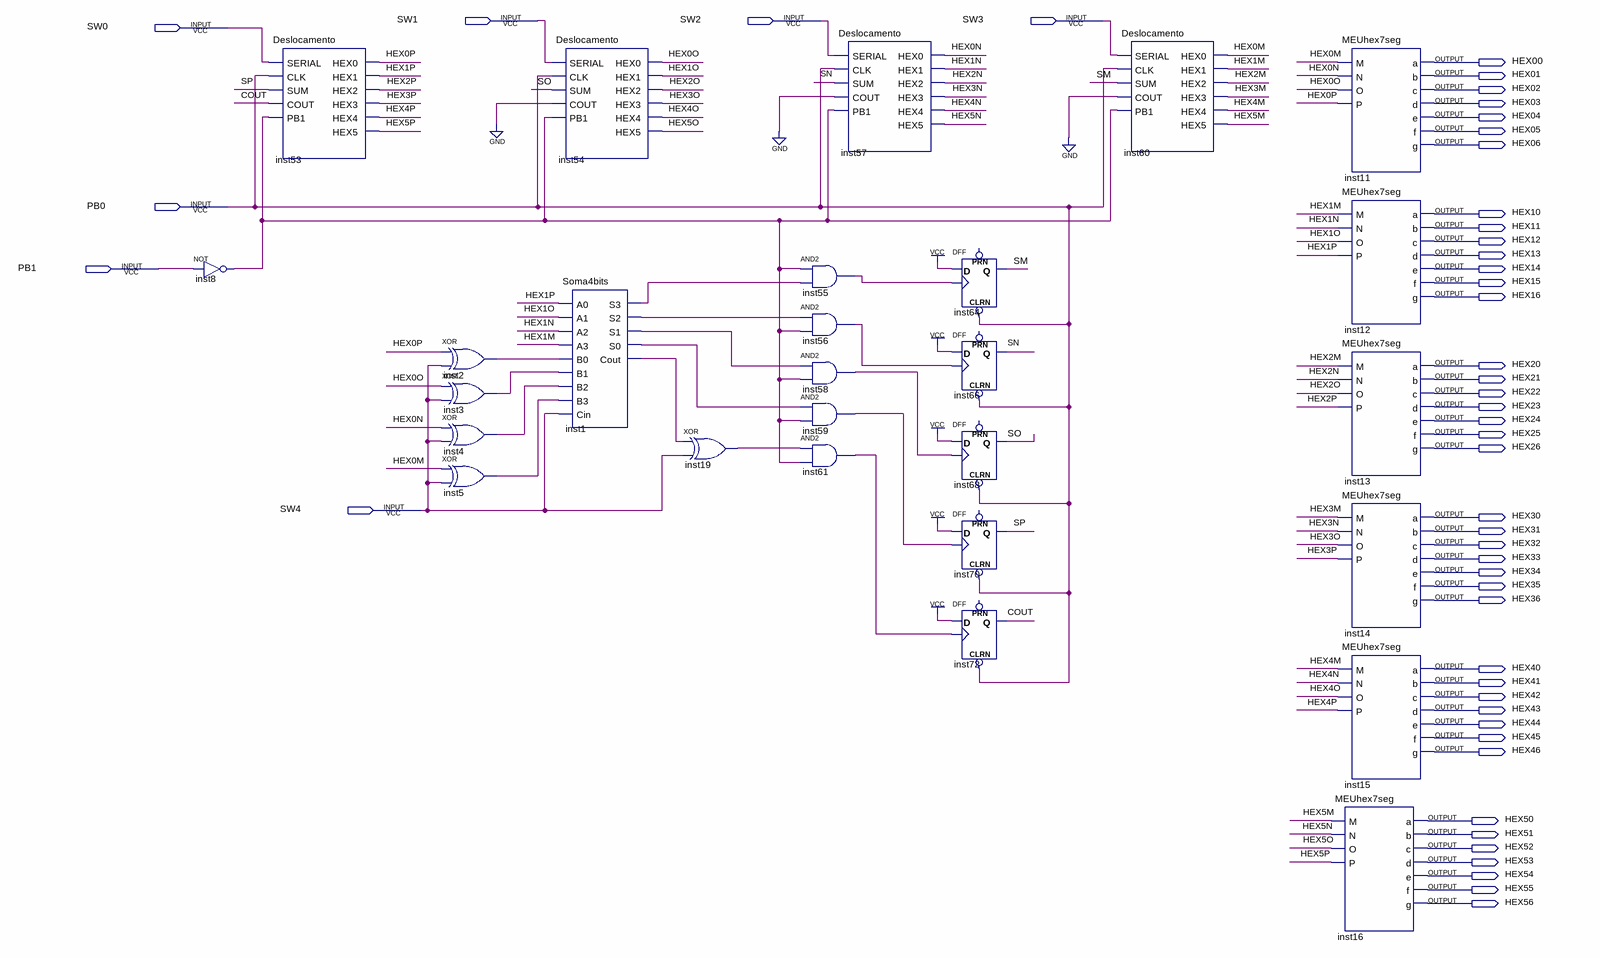
[diagram p0: schematic sheet]
// Quartus schematic Lab2-2.bdf as structural Verilog: 27 symbols, 49 pins
module \Lab2-2  (
  input  SW1,
  input  SW2,
  input  SW3,
  input  SW0,
  input  PB0,
  input  PB1,
  input  SW4,
  output HEX00,
  output HEX01,
  output HEX02,
  output HEX03,
  output HEX04,
  output HEX05,
  output HEX06,
  output HEX10,
  output HEX11,
  output HEX12,
  output HEX13,
  output HEX14,
  output HEX15,
  output HEX16,
  output HEX20,
  output HEX21,
  output HEX22,
  output HEX23,
  output HEX24,
  output HEX25,
  output HEX26,
  output HEX30,
  output HEX31,
  output HEX32,
  output HEX33,
  output HEX34,
  output HEX35,
  output HEX36,
  output HEX40,
  output HEX41,
  output HEX42,
  output HEX43,
  output HEX44,
  output HEX45,
  output HEX46,
  output HEX50,
  output HEX51,
  output HEX52,
  output HEX53,
  output HEX54,
  output HEX55,
  output HEX56
);

  wire COUT, HEX0M, HEX0N, HEX0O, HEX0P, HEX1M, HEX1N, HEX1O, HEX1P, HEX2M, HEX2N, HEX2O, HEX2P, HEX3M,
       HEX3N, HEX3O, HEX3P, HEX4M, HEX4N, HEX4O, HEX4P, HEX5M, HEX5N, HEX5O, HEX5P, inst1_cout, inst1_s0,
       inst1_s1, inst1_s2, inst1_s3, inst2_out, inst3_out, inst4_out, inst5_out, inst8_out, inst19_out,
       inst55_out, inst56_out, inst58_out, inst59_out, inst61_out, SM, SN, SO, SP;

  not inst8 (inst8_out, PB1);
  Deslocamento inst53 (
    .SERIAL(SW0), .CLK(PB0), .SUM(SP), .COUT(COUT), .PB1(inst8_out), .HEX0(HEX0P), .HEX1(HEX1P),
    .HEX2(HEX2P), .HEX3(HEX3P), .HEX4(HEX4P), .HEX5(HEX5P));
  xor inst2 (inst2_out, HEX0P, SW4);
  xor inst3 (inst3_out, HEX0O, SW4);
  xor inst4 (inst4_out, HEX0N, SW4);
  xor inst5 (inst5_out, HEX0M, SW4);
  Deslocamento inst54 (
    .SERIAL(SW1), .CLK(PB0), .SUM(SO), .COUT(1'b0), .PB1(inst8_out), .HEX0(HEX0O), .HEX1(HEX1O),
    .HEX2(HEX2O), .HEX3(HEX3O), .HEX4(HEX4O), .HEX5(HEX5O));
  Soma4bits inst1 (
    .A0(HEX1P), .A1(HEX1O), .A2(HEX1N), .A3(HEX1M), .B0(inst2_out), .B1(inst3_out), .B2(inst4_out),
    .B3(inst5_out), .Cin(SW4), .S3(inst1_s3), .S2(inst1_s2), .S1(inst1_s1), .S0(inst1_s0), .Cout(inst1_cout));
  xor inst19 (inst19_out, inst1_cout, SW4);
  and inst55 (inst55_out, inst8_out, inst1_s3);
  and inst56 (inst56_out, inst1_s2, inst8_out);
  and inst58 (inst58_out, inst1_s1, inst8_out);
  and inst59 (inst59_out, inst1_s0, inst8_out);
  and inst61 (inst61_out, inst19_out, inst8_out);
  Deslocamento inst57 (
    .SERIAL(SW2), .CLK(PB0), .SUM(SN), .COUT(1'b0), .PB1(inst8_out), .HEX0(HEX0N), .HEX1(HEX1N),
    .HEX2(HEX2N), .HEX3(HEX3N), .HEX4(HEX4N), .HEX5(HEX5N));
  DFF inst64 (.CLRN(PB0), .CLK(inst55_out), .D(1'b1), .Q(SM));  // open: PRN
  DFF inst66 (.CLRN(PB0), .CLK(inst56_out), .D(1'b1), .Q(SN));  // open: PRN
  DFF inst68 (.CLRN(PB0), .CLK(inst58_out), .D(1'b1), .Q(SO));  // open: PRN
  DFF inst70 (.CLRN(PB0), .CLK(inst59_out), .D(1'b1), .Q(SP));  // open: PRN
  DFF inst72 (.CLRN(PB0), .CLK(inst61_out), .D(1'b1), .Q(COUT));  // open: PRN
  Deslocamento inst60 (
    .SERIAL(SW3), .CLK(PB0), .SUM(SM), .COUT(1'b0), .PB1(inst8_out), .HEX0(HEX0M), .HEX1(HEX1M),
    .HEX2(HEX2M), .HEX3(HEX3M), .HEX4(HEX4M), .HEX5(HEX5M));
  MEUhex7seg inst11 (
    .M(HEX0M), .N(HEX0N), .O(HEX0O), .P(HEX0P), .a(HEX00), .b(HEX01), .c(HEX02), .d(HEX03), .e(HEX04),
    .f(HEX05), .g(HEX06));
  MEUhex7seg inst12 (
    .M(HEX1M), .N(HEX1N), .O(HEX1O), .P(HEX1P), .a(HEX10), .b(HEX11), .c(HEX12), .d(HEX13), .e(HEX14),
    .f(HEX15), .g(HEX16));
  MEUhex7seg inst13 (
    .M(HEX2M), .N(HEX2N), .O(HEX2O), .P(HEX2P), .a(HEX20), .b(HEX21), .c(HEX22), .d(HEX23), .e(HEX24),
    .f(HEX25), .g(HEX26));
  MEUhex7seg inst14 (
    .M(HEX3M), .N(HEX3N), .O(HEX3O), .P(HEX3P), .a(HEX30), .b(HEX31), .c(HEX32), .d(HEX33), .e(HEX34),
    .f(HEX35), .g(HEX36));
  MEUhex7seg inst15 (
    .M(HEX4M), .N(HEX4N), .O(HEX4O), .P(HEX4P), .a(HEX40), .b(HEX41), .c(HEX42), .d(HEX43), .e(HEX44),
    .f(HEX45), .g(HEX46));
  MEUhex7seg inst16 (
    .M(HEX5M), .N(HEX5N), .O(HEX5O), .P(HEX5P), .a(HEX50), .b(HEX51), .c(HEX52), .d(HEX53), .e(HEX54),
    .f(HEX55), .g(HEX56));
endmodule
